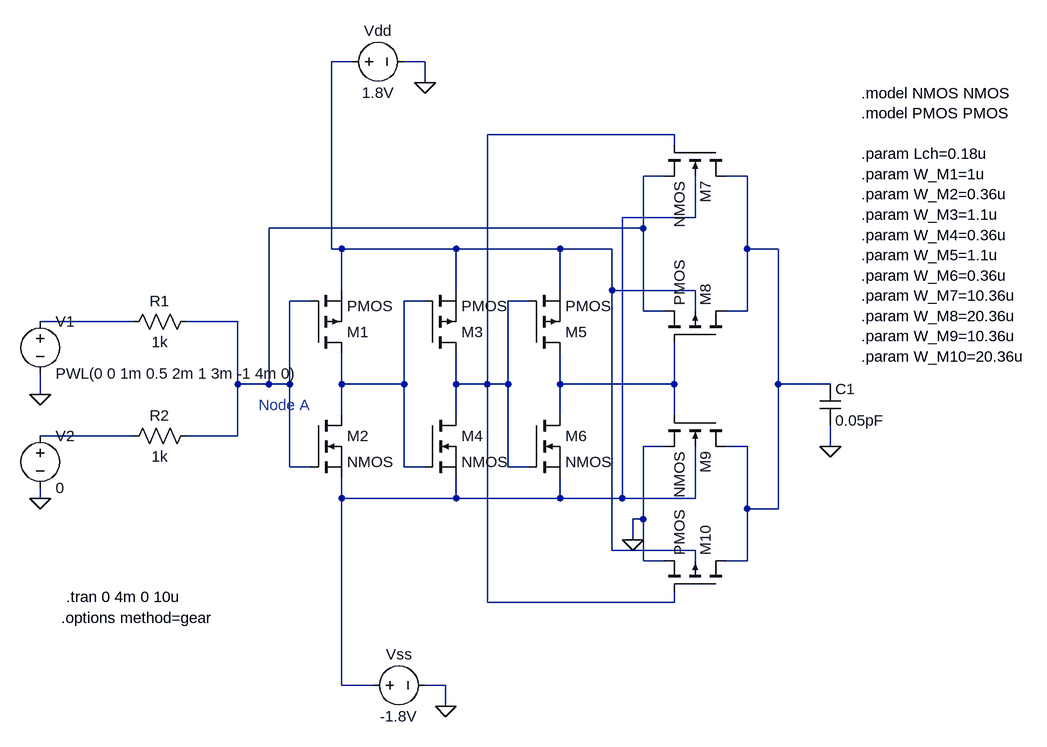
[diagram p0: schematic neuron_ReLU.asc]
neuron_ReLU.asc, the LTspice schematic file:
Version 4.1
SHEET 1 1656 680
WIRE 592 -368 560 -368
WIRE 704 -368 672 -368
WIRE 704 -336 704 -368
WIRE 1088 -256 800 -256
WIRE 1088 -240 1088 -256
WIRE 1072 -192 1040 -192
WIRE 1200 -192 1168 -192
WIRE 1120 -128 1120 -192
WIRE 1120 -128 1008 -128
WIRE 1040 -112 1040 -192
WIRE 1040 -112 464 -112
WIRE 560 -80 560 -368
WIRE 576 -80 560 -80
WIRE 752 -80 576 -80
WIRE 912 -80 752 -80
WIRE 992 -80 912 -80
WIRE 1200 -80 1200 -192
WIRE 1248 -80 1200 -80
WIRE 576 -16 576 -80
WIRE 752 -16 752 -80
WIRE 912 -16 912 -80
WIRE 992 -16 992 -80
WIRE 1120 -16 992 -16
WIRE 528 0 496 0
WIRE 704 0 672 0
WIRE 864 0 832 0
WIRE 1040 16 1040 -112
WIRE 1072 16 1040 16
WIRE 1120 16 1120 -16
WIRE 1200 16 1200 -80
WIRE 1200 16 1168 16
WIRE 256 32 112 32
WIRE 416 32 336 32
WIRE 416 128 416 32
WIRE 464 128 464 -112
WIRE 464 128 416 128
WIRE 496 128 496 0
WIRE 496 128 464 128
WIRE 576 128 576 80
WIRE 672 128 672 0
WIRE 672 128 576 128
WIRE 752 128 752 80
WIRE 800 128 800 -256
WIRE 800 128 752 128
WIRE 832 128 832 0
WIRE 832 128 800 128
WIRE 912 128 912 80
WIRE 1088 128 1088 64
WIRE 1088 128 912 128
WIRE 1248 128 1248 -80
WIRE 1328 128 1248 128
WIRE 112 144 112 112
WIRE 576 176 576 128
WIRE 752 176 752 128
WIRE 912 176 912 128
WIRE 1088 176 1088 128
WIRE 256 208 112 208
WIRE 416 208 416 128
WIRE 416 208 336 208
WIRE 1072 224 1040 224
WIRE 1200 224 1168 224
WIRE 1328 224 1328 192
WIRE 496 256 496 128
WIRE 528 256 496 256
WIRE 672 256 672 128
WIRE 704 256 672 256
WIRE 832 256 832 128
WIRE 864 256 832 256
WIRE 112 304 112 288
WIRE 576 304 576 272
WIRE 752 304 752 272
WIRE 752 304 576 304
WIRE 912 304 912 272
WIRE 912 304 752 304
WIRE 1008 304 1008 -128
WIRE 1008 304 912 304
WIRE 1120 304 1120 224
WIRE 1120 304 1008 304
WIRE 1200 320 1200 224
WIRE 1248 320 1248 128
WIRE 1248 320 1200 320
WIRE 1040 336 1040 224
WIRE 1040 336 1024 336
WIRE 1024 368 1024 336
WIRE 992 384 992 -16
WIRE 1120 384 992 384
WIRE 1040 400 1040 336
WIRE 1072 400 1040 400
WIRE 1120 400 1120 384
WIRE 1200 400 1200 320
WIRE 1200 400 1168 400
WIRE 800 464 800 128
WIRE 1088 464 1088 448
WIRE 1088 464 800 464
WIRE 576 592 576 304
WIRE 624 592 576 592
WIRE 736 592 704 592
WIRE 736 624 736 592
FLAG 112 144 0
FLAG 112 304 0
FLAG 704 -336 0
FLAG 736 624 0
FLAG 1024 368 0
FLAG 1328 224 0
SYMBOL voltage 112 16 R0
WINDOW 123 0 0 Left 0
WINDOW 39 0 0 Left 0
SYMATTR InstName V1
SYMATTR Value PWL(0 0 1m 0.5 2m 1 3m -1 4m 0)
SYMBOL voltage 112 192 R0
SYMATTR InstName V2
SYMATTR Value 0
SYMBOL res 352 16 R90
WINDOW 0 0 56 VBottom 2
WINDOW 3 32 56 VTop 2
SYMATTR InstName R1
SYMATTR Value 1k
SYMBOL res 352 192 R90
WINDOW 0 0 56 VBottom 2
WINDOW 3 32 56 VTop 2
SYMATTR InstName R2
SYMATTR Value 1k
SYMBOL pmos 528 80 M180
SYMATTR InstName M1
SYMBOL pmos 704 80 M180
SYMATTR InstName M3
SYMBOL pmos 864 80 M180
SYMATTR InstName M5
SYMBOL nmos 528 176 R0
SYMATTR InstName M2
SYMBOL nmos 704 176 R0
SYMATTR InstName M4
SYMBOL nmos 864 176 R0
SYMATTR InstName M6
SYMBOL pmos4 1168 64 M270
SYMATTR InstName M8
SYMBOL pmos4 1168 448 M270
SYMATTR InstName M10
SYMBOL nmos4 1168 -240 R90
SYMATTR InstName M7
SYMBOL nmos4 1168 176 R90
SYMATTR InstName M9
SYMBOL voltage 576 -368 R270
WINDOW 0 32 56 VTop 2
WINDOW 3 -32 56 VBottom 2
WINDOW 123 0 0 Left 0
WINDOW 39 0 0 Left 0
SYMATTR InstName Vdd
SYMATTR Value 1.8V
SYMBOL voltage 608 592 R270
WINDOW 0 32 56 VTop 2
WINDOW 3 -32 56 VBottom 2
SYMATTR InstName Vss
SYMATTR Value -1.8V
SYMBOL cap 1312 128 R0
SYMATTR InstName C1
SYMATTR Value 0.05pF
TEXT 1376 -320 Left 2 !.model NMOS NMOS\n.model PMOS PMOS\n \n.param Lch=0.18u\n.param W_M1=1u\n.param W_M2=0.36u\n.param W_M3=1.1u\n.param W_M4=0.36u\n.param W_M5=1.1u\n.param W_M6=0.36u\n.param W_M7=10.36u\n.param W_M8=20.36u\n.param W_M9=10.36u\n.param W_M10=20.36u
TEXT 448 160 Left 2 ;Node A
TEXT 152 456 Left 2 !.tran 0 4m 0 10u
TEXT 144 488 Left 2 !.options method=gear

The netlist it stands for:
* neuron_ReLU.asc
V1 N007 0 PWL(0 0 1m 0.5 2m 1 3m -1 4m 0)
V2 N009 0 0
R1 N003 N007 1k
R2 N003 N009 1k
M1 N006 N003 N001 N001 PMOS
M3 N002 N006 N001 N001 PMOS
M5 N008 N002 N001 N001 PMOS
M2 N006 N003 N005 N005 NMOS
M4 N002 N006 N005 N005 NMOS
M6 N008 N002 N005 N005 NMOS
M8 N004 N008 N003 N001 PMOS
M10 N004 N002 0 N001 PMOS
M7 N004 N002 N003 N005 NMOS
M9 N004 N008 0 N005 NMOS
Vdd N001 0 1.8V
Vss N005 0 -1.8V
C1 N004 0 0.05pF
.model NMOS NMOS
.model PMOS PMOS
.lib standard.mos
.model NMOS NMOS
.model PMOS PMOS
.param Lch=0.18u
.param W_M1=1u
.param W_M2=0.36u
.param W_M3=1.1u
.param W_M4=0.36u
.param W_M5=1.1u
.param W_M6=0.36u
.param W_M7=10.36u
.param W_M8=20.36u
.param W_M9=10.36u
.param W_M10=20.36u
* Node A
.tran 0 4m 0 10u
.options method=gear
.backanno
.end